# Altium schematic sheet 01_POWER_IO.SchDoc
size A4; SheetNumber: 1; SheetTotal: 6
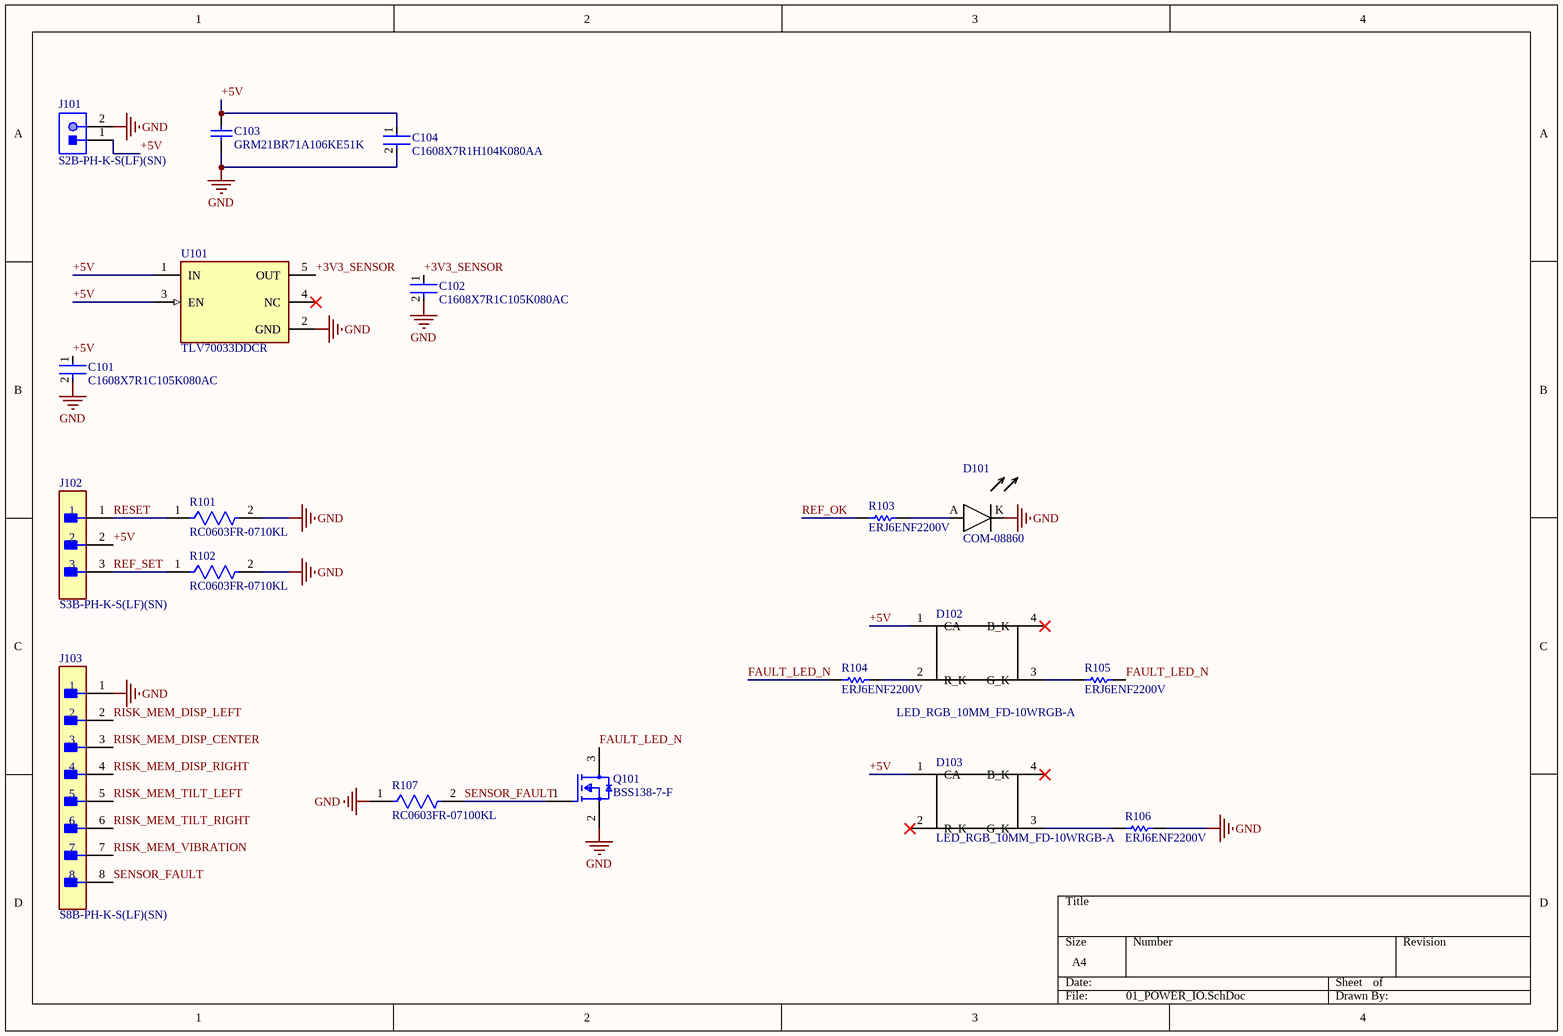
[diagram p0: 01_POWER_IO.SchDoc]

## Parts
C101  C1608X7R1C105K080AC  [FP-C1608-080-0_1-IPC_B]
C102  C1608X7R1C105K080AC  [FP-C1608-080-0_1-IPC_B]
C103  GRM21BR71A106KE51K  [CAPC2013X140X45ML15T25]
C104  C1608X7R1H104K080AA  [FP-C1608-080-0_1-IPC_B]
D101  COM-08860  [LED_10MM_COM-08860]
D102  LED_RGB_10MM_FD-10WRGB-A  [LED_THT_RGB_10MM_FD10WRGBA]
D103  LED_RGB_10MM_FD-10WRGB-A  [LED_THT_RGB_10MM_FD10WRGBA]
J101  S2B-PH-K-S(LF)(SN)  [JST-S2B-PH-K-S_V]
J102  S3B-PH-K-S(LF)(SN)  [FP-S3B-PH-K-S_LF_SN-MFG]
J103  S8B-PH-K-S(LF)(SN)  [FP-S8B-PH-K-S_LF_SN-MFG]
Q101  BSS138-7-F  [FP-SOT23_Standard-MFG]
R101  RC0603FR-0710KL  [FP-RC0603-0_55-IPC_C]
R102  RC0603FR-0710KL  [FP-RC0603-0_55-IPC_C]
R103  ERJ6ENF2200V  [RESC2013X70X40NL20T20]
R104  ERJ6ENF2200V  [RESC2013X70X40NL20T20]
R105  ERJ6ENF2200V  [RESC2013X70X40NL20T20]
R106  ERJ6ENF2200V  [RESC2013X70X40NL20T20]
R107  RC0603FR-07100KL  [FP-RC0603-0_55-MFG]
U101  TLV70033DDCR  [FP-DDC0005A-IPC_A]

## Nets
GND: C101.2 C102.2 C103.1 C104.2 D101.K(CATHODE) J101.2 J103.1 Q101.2(S) R101.2 R102.2 R106.2 R107.1 U101.2(GND)
+3V3_SENSOR: C102.1 U101.5(OUT)
+5V: C101.1 C103.2 C104.1 D102.1(CA) D103.1(CA) J101.1 J102.2 U101.1(IN) U101.3(EN)
FAULT_LED_N: Q101.3(D) R104.1 R105.2
REF_OK: R103.1
REF_SET: J102.3 R102.1
RESET: J102.1 R101.1
RISK_MEM_DISP_CENTER: J103.3
RISK_MEM_DISP_LEFT: J103.2
RISK_MEM_DISP_RIGHT: J103.4
RISK_MEM_TILT_LEFT: J103.5
RISK_MEM_TILT_RIGHT: J103.6
RISK_MEM_VIBRATION: J103.7
SENSOR_FAULT: J103.8 Q101.1(G) R107.2
NetD101_A: D101.A(ANODE) R103.2
NetD102_2: D102.2(R_K) R104.2
NetD102_3: D102.3(G_K) R105.1
NetD103_3: D103.3(G_K) R106.1

Not connected (* = marked no-connect by the designer): D102 4(B_K)*; D103 2(R_K)* 4(B_K)*; U101 4(NC)*

## Library data of the parts
C101 C102 = CMP-08246-002727-1: Multilayer Ceramic Capacitors 1μF ±10% 16V X7R SMD 0603; Capacitance: 1uF; Mount: Surface Mount; Width: 0.031inch; Radiation Hardening: No; Dielectric Material: Ceramic; Packaging: Tape and Reel; Voltage Rating: 16V; Weight: 7.1E-05oz; Termination: SMD/SMT; Package Quantity: 1; Voltage Rating (DC): 16V; REACH SVHC: No SVHC; Voltage: 16V; Min Operating Temperature: -55°C; Depth: 0.8mm; Height: 0.8mm; Length: 1.6mm; Case Code (Metric): 1608; Thickness: 0.037inch; Lead Free: Lead Free; Resistor Type: Ceramic; RoHS Compliant: Yes; Series: C; Construction: Flat; Max Operating Temperature: 125°C; Tolerance: 10%; Case/Package: 0603; Dielectric: X7R; Case Code (Imperial): 0603
C103 = CMP-2007-03370-1: Manufacturer: Murata; Part Number: GRM21BR71A106KE51K
C104 = CMP-2000-04982-2: Multilayer Ceramic Capacitors 100nF ±10% 50V X7R SMD 0603; REACH SVHC: No SVHC; Voltage: 50V; Min Operating Temperature: -55°C; Package Quantity: 1; Case Code (Metric): 1608; Series: C; Termination: SMD/SMT; Length: 1.6mm; Voltage Rating: 50V; Case Code (Imperial): 0603; Number of Pins: 2; RoHS Compliant: Yes; Thickness: 0.037inch; Resistor Type: Ceramic; Radiation Hardening: No; Weight: 7.1E-05oz; Mount: Surface Mount; Capacitance: 100nF; Voltage Rating (DC): 50V; Construction: Flat; Tolerance: 10%; Lead Free: Lead Free; Case/Package: 0603; Max Operating Temperature: 125°C; Height: 0.8mm; Depth: 0.8mm; Packaging: Tape and Reel; Width: 0.031inch; Dielectric Material: Ceramic; Dielectric: X7R
D101 = COM-08860: Blue 10mm THT LED
J101 = CMP-1755-00004-1: Male Header, Pitch 2 mm, 1 x 2 Position, Height 4.8 mm, Tail Length 3.4 mm, -25 to 85 degC, RoHS, Bulk; Case\Package: Radial; Tolerance: 20%; Capacitance: 10 uF; Voltage Rating (DC): 50 V; Packaging: Bulk; ComponentLink1URL: http://www.jst-mfg.com/product/pdf/eng/ePH.pdf; Radiation Hardening: No; Height: 11 mm; Package Quantity: 200; PackageDescription: Male Header, Pitch 2 mm, 1 x 2 Position, Height 4.8 mm, Tail Length 3.4 mm; PackageReference: S2B-PH-K-S; Diameter: 5 mm; Pins: 2; Mount: Through Hole; Max Operating Temperature: 85 degC; Min Operating Temperature: -40 degC; ComponentLink1Description: Datasheet; DatasheetVersion: Dec-12; Length: 11 mm; Lead Pitch: 2 mm; REACH SVHC: No SVHC; Voltage Rating: 50 V; RoHSCompliant: true
J102 = CMP-17439-000039-1: CONN HEADER R/A 3POS 2MM; Height: 0.31inch; Weight: 0.0625lb; Length: 0.31inch; Width: 0.31inch
J103 = CMP-17439-000161-1: CONN HEADER R/A 8POS 2MM; Number of Positions: 8; Voltage Rating: 100V; Insulation Resistance: 1GR; Current Rating: 2A; Gender: Male; Contact Resistance: 20mR; Contact Mating Length: 0.13inch; Width: 4.5mm; Contact Finish - Mating: TIN; Insulation Color: Natural; Housing Color: White; Depth: 7.6mm; Min Operating Temperature: -25°C; Lead Pitch: 2mm; Number of Poles: 8; Number of Rows: 1; Height: 9.4mm; REACH SVHC: No SVHC; Contact Type: Male Pin; Length: 17.9mm; Lead Free: Lead Free; Pitch: 2mm; Number of Contacts: 8; Orientation: Right Angle; Flammability Rating: UL94 V-0; Max Operating Temperature: 85°C; Mount: Through Hole; Contact Shape: Square; Termination: Solder; Fastening Type: Detent; Packaging: Bulk; Series: PH; Voltage Rating (AC): 100V; Insulation Material: Nylon; Working Voltage: 100V; Contact Plating: Tin; Housing Material: Polyamide; Connector Type: Header; Number of Pins: 8; Max Voltage Rating (AC): 100V; Max Current Rating: 2A; Contact Material: Brass; Color: White
Q101 = CMP-2000-04930-2: NexarPartId: 335900; Voltage: 50V; Fall Time: 25ns; Number of Elements: 1; Turn-On Delay Time: 20ns; Drain to Source Resistance: 1.4Ω; Element Configuration: Single; Max Power Dissipation: 300mW; Current Rating: 200mA; Max Junction Temperature (Tj): 150°C; Input Capacitance: 50pF; Threshold Voltage: 1.2V; Current: 2A; Rds On Max: 3.5Ω; Rise Time: 10ns; Gate to Source Voltage (Vgs): 20V; Number of Pins: 3; Width: 1.3mm; Case/Package: SOT-23; Lead Free: Lead Free; Height: 1.15mm; Packaging: Cut Tape; Length: 2.9mm; REACH SVHC: No SVHC; Weight: 7.994566mg; Voltage Rating (DC): 50V; Contact Plating: Tin; Power Dissipation: 300mW; Mount: Surface Mount; Min Operating Temperature: -55°C; RoHS: Compliant; Max Operating Temperature: 150°C; Schedule B: 8541210080, 8541210080; Drain to Source Breakdown Voltage: 50V; Continuous Drain Current (ID): 200mA; Resistance: 3.5Ω; Number of Channels: 1; Drain to Source Voltage (Vdss): 50V; Turn-Off Delay Time: 20ns; Nominal Vgs: 1.2V
R101 R102 = CMP-2100-03664-2: RES 10K OHM 1% 1/10W 0603; Voltage Rating: 75V; Voltage Rating (DC): 50V; Resistance: 10kR; Power Rating: 100mW; Temperature Coefficient: 100ppm/°C; Depth: 0.8mm; Termination: SMD/SMT; Resistor Type: Thick Film; Series: RC; Construction: Rectangular; Features: Moisture Resistant; Packaging: Tape and Reel; Min Operating Temperature: -55°C; Number of Terminations: 2; Lead Pitch: 0.3mm; RoHS Compliant: Yes; Case/Package: 0603; Resistance Tolerance: 1%; Military Standard: Not; Weight: 7.1E-05oz; Number of Pins: 2; Tolerance: 1%; Length: 1.6mm; Case Code (Imperial): 0603; Lead Free: Lead Free; Width: 0.8mm; Max Power Dissipation: 100mW; Height: 0.45mm; Max Operating Temperature: 155°C; Case Code (Metric): 1608; Size Code: 0603
R103-R106 = CMP-2001-00044-1: Manufacturer: Panasonic; Part Number: ERJ6ENF2200V
R107 = CMP-2100-03662-2: RES SMD 100K OHM 1% 1/10W 0603; Voltage Rating (DC): 50V; Resistance: 100kR; Max Power Dissipation: 100mW; Temperature Coefficient: 100ppm/°C; Working Voltage: 75V; Length: 1.6mm; Lead Free: Lead Free; Number of Terminations: 2; Packaging: Tape and Reel; Voltage Rating: 50V; Termination: SMD/SMT; Width: 0.8mm; Resistor Type: Thick Film; Resistance Tolerance: 1%; Features: Moisture Resistant; Height: 0.45mm; Construction: Rectangular; Case/Package: 0603; Military Standard: Not; Case Code (Imperial): 0603; Series: RC; Technology: THICK FILM; Depth: 0.8mm; RoHS Compliant: Yes; REACH SVHC: No SVHC; Min Operating Temperature: -55°C; Case Code (Metric): 1608; Max Operating Temperature: 155°C; Power Rating: 100mW; Number of Pins: 2; Tolerance: 1%
U101 = CMP-0394-01056-3: IC REG LINEAR 3.3V 200MA SOT23-5; Number of Outputs: 1; Max Input Voltage: 5.5V; Dropout Voltage: 175mV; Output Voltage Accuracy: 2%; Min Current Limit: 220mA; Min Input Voltage: 2V; Max Power Dissipation: 500mW; Polarity: Positive; Output Type: Fixed; Quiescent Current: 30uA; Output Current: 200mA; Min Operating Temperature: -40°C; Number of Pins: 5; Package Quantity: 1; Max Operating Temperature: 125°C; Case/Package: TSOT; Max Output Voltage: 3.3V; Max Output Current: 200mA; REACH SVHC: No SVHC; Accuracy: 2%; Lead Free: Lead Free; Output Voltage: 3.3V; Radiation Hardening: No; Packaging: Tape and Reel; Nominal Output Voltage: 3.3V; Power Dissipation: 500mW; Number of Regulators: 1; Min Output Voltage: 3.3V